# EasyEDA Pro project CAN Bus IO Module.epro, board PCB4
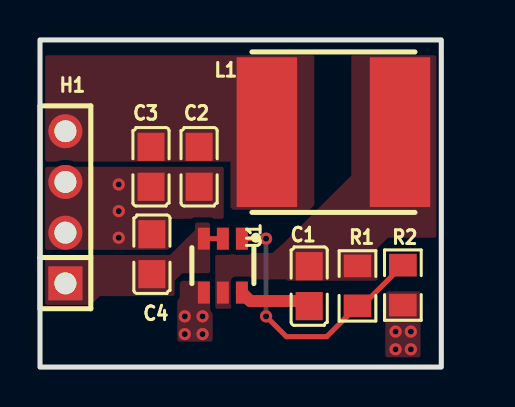
[diagram p8: board, top side]
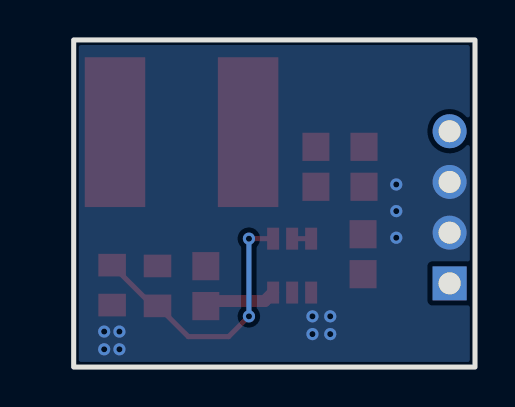
[diagram p9: board, bottom side, seen from below]

Outline 20.07 x 16.38 mm; copper layers: Top Layer, Bottom Layer. Coordinates in mm from the lower left corner of the outline.
Outline path: rectangle 0,16.38 20.07,0
Stack: Top Layer 0.035mm / Dielectric1 1.51mm FR4 er 4.5 / Bottom Layer 0.035mm

## Design rules (mm)
template: JLCPCB Capability(Two Layers Board)
spacing copperThickness1oz (default): track to track 0.102, other pairs 0.152 to 0.3
spacing copperThickness2oz: track to track 0.203, other pairs 0.152 to 0.3
track width copperThickness1oz (default): min 0.127, default 0.254, max 2.54
track width copperThickness2oz: min 0.203, default 0.254, max 2.54
differential pair differentialPair (default): width min 0.127, default 0.254, max 2.54; gap min 0.152, default 0.152
via viaSize (default): diameter min 0.5, default 0.61, max 10; hole min 0.3, default 0.305, max 6.3

## Placement (name value [footprint] x y rotation side)
C1  100nF  [C0805]  13.46 4.05 270 top
C2  22uF  [C0805]  7.96 10.03 90 top
C3  22uF  [C0805]  5.55 10.03 90 top
C4  2.2uF  [C0805]  5.6 5.65 90 top
H1  -  [HDR-TH_4P-P2.54-V-M]  1.27 8 90 top
L1  10uH  [IND-SMD_L8.0-W8.0]  14.67 11.76 0 top
R1  53.6kΩ  [R0805]  15.88 4.06 90 top
R2  10.2K  [R0805]  18.14 4.1 90 top
U1  LMR51635XDDCR  [SOT-23-6_L2.9-W1.6-P0.95-LS2.8-BR]  9.14 5.08 90 top

## Footprints (pads in the part's own frame, mm; a bottom-side part is the same pattern mirrored in y, then rotated)
C0805
  rect 1.41x1.35 smd: 1(-1,0) 2(1,0)
HDR-TH_4P-P2.54-V-M
  rect 1.7x1.7 hole 1.1: 1(-3.81,0)
  round 1.7 hole 1.1: 2(-1.27,0) 3(1.27,0) 4(3.81,0)
IND-SMD_L8.0-W8.0
  rect 3.024x7.5 smd: 1(3.328,0) 2(-3.328,0)
R0805
  rect 1.133x1.377 smd: 1(-1,0) 2(1,0)
SOT-23-6_L2.9-W1.6-P0.95-LS2.8-BR
  rect 1.1x0.6 smd: 1(1.35,-0.95) 2(1.35,0) 3(1.35,0.95) 4(-1.35,0.95) 5(-1.35,0) 6(-1.35,-0.95)

## Nets
As in the schematic.

## Via types
v1: diameter 0.61, hole 0.305, Top Layer to Bottom Layer, 13 vias

## Routing (per net, layer and track width the routed paths; a pad name or vN(x,y) marks a point on that pad's centre or on a via; arc(x,y) is an arc through that point)
GND:
  vias: v1(3.94,9.14) v1(3.94,7.81) v1(3.94,6.48) v1(7.24,2.54) v1(7.24,1.65) v1(8.13,2.54) v1(8.13,1.65) v1(17.78,1.78) v1(17.78,0.89) v1(18.54,1.78) v1(18.54,0.89)
VCC: length 1
  Top Layer w0.254: 8.19,6.43 U1.2
$1N624: length 13.8
  Top Layer w0.254: R2.2 16.1,3.06 R1.1 14.34,1.52 12.32,1.52 v1(11.3,2.54) ; U1.1 v1(11.3,6.43)
  Bottom Layer w0.254: v1(11.3,6.43) v1(11.3,2.54)
$1N677: length 3.6
  Top Layer w0.6: U1.6 10.52,3.31 13.21,3.31 C1.2

## Copper pours and planes (outline as drawn; the poured copper is in the pictures)
+5V on Top Layer: 13.72,15.62 13.72,7.87 9.65,7.87 9.53,8 9.53,10.29 0,10.29 0,15.62
GND on Top Layer: 17.26,3.79 19.03,3.79 19.03,0.49 17.26,0.49
GND on Top Layer: 6.87,4.32 8.64,4.32 8.64,1.27 6.87,1.27
GND on Top Layer: 0.24,10.03 9.19,10.03 9.19,7.42 6.48,7.42 6.48,5.75 0.24,5.75
GND on Bottom Layer: -3.43,18.16 26.03,18.16 26.03,-2.79 -3.43,-2.79
VCC on Top Layer: 0,5.61 6.5,5.61 7.75,6.86 7.75,7.24 8.51,7.24 8.51,4.7 7.11,4.7 6.73,4.32 6.73,3.56 2.98,3.56 2.54,3.11 0,3.11
$1N674 on Top Layer: 12.93,6.35 12.34,6.35 11.62,5.72 8.76,5.72 8.76,2.92 9.6,2.92 9.6,4.39 12.93,4.39
$1N674 on Top Layer: 12.32,4.32 16.89,4.32 16.89,5.97 17.4,6.48 19.81,6.48 19.81,15.62 15.56,15.62 15.56,9.59 12.32,6.35
